# Altium schematic sheet 01.Izdelie.Units.SchDoc: Электронные модули и кабели
size 209 x 297 mm; Author: Мурашкин Д.В.; Address1: Address1; Address2: Address2; Address3: Address3; Address4: Address4; DocumentNumber: ИЗДЕЛИЕ-1-2 Э6; SheetNumber: 2; Scale: 1:1; Letter1Column: Э6
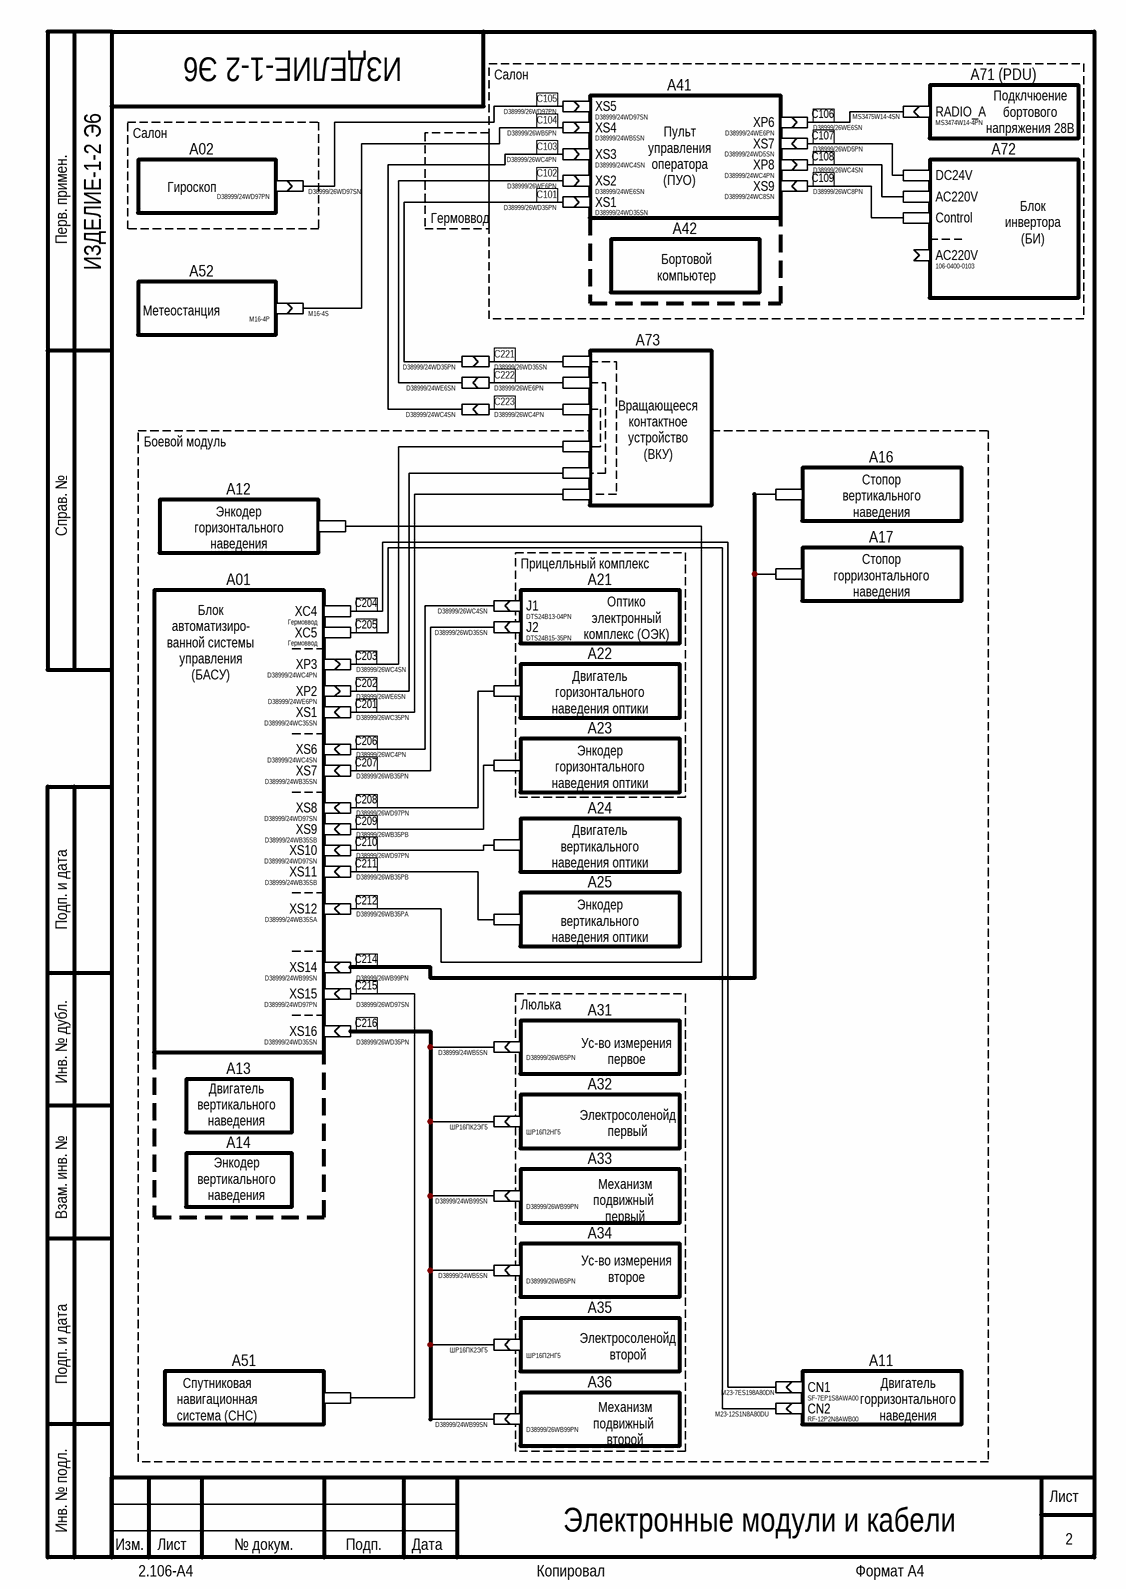
[diagram p0: 01.Izdelie.Units.SchDoc]

## Parts
(Parts that share a designator on the sheet are numbered #1, #2 ... from top to bottom, then left to right.)
A01.XP1  D38999/26WC35PN
A01.XP6  D38999/26WC4PN
A01.XP7  D38999/26WB35PN
A01.XP8  D38999/26WD97PN
A01.XP9  D38999/26WB35PB
A01.XP10  D38999/26WD97PN
A01.XP11  D38999/26WB35PB
A01.XP12  D38999/26WB35PA
A01.XP14  D38999/26WB99PN
A01.XP15  D38999/26WD97SN
A01.XP16  D38999/26WD35PN
A01.XS2  D38999/26WE6SN
A01.XS3  D38999/26WC4SN
A01.XS16.1  D38999/24WB5SN
A01.XS16.2  ШР16ПК2ЭГ5
A01.XS16.3  D38999/24WB99SN
A01.XS16.4  D38999/24WB5SN
A01.XS16.5  ШР16ПК2ЭГ5
A01.XS16.6  D38999/24WB99SN
A02.XP1  D38999/24WD97PN
A02.XS1  D38999/26WD97SN
A11.XS1  M23-7ES198A80DN  (no BOM)
A11.XS2  M23-12S1N8A80DU  (no BOM)
A12.XC1  Провод  (value not drawn)  (no BOM)
A16.XC1  Провод  (value not drawn)  (no BOM)
A17.XC1  Провод  (value not drawn)  (no BOM)
A21.XS1  D38999/26WC4SN
A21.XS2  D38999/26WD35SN
A22.XC1  Провод  (value not drawn)  (no BOM)
A23.XC1  Провод  (value not drawn)  (no BOM)
A24.XC1  Провод  (value not drawn)  (no BOM)
A25.XC1  Провод  (value not drawn)  (no BOM)
A31.XP1  D38999/26WB5PN
A32.XP1  ШР16П2НГ5  (no BOM)
A33.XP1  D38999/26WB99PN
A34.XP1  D38999/26WB5PN
A35.XP1  ШР16П2НГ5  (no BOM)
A36.XP1  D38999/26WB99PN
A41.XP1  D38999/26WD35PN
A41.XP2  D38999/26WE6PN
A41.XP3  D38999/26WC4PN
A41.XP4  D38999/26WB5PN
A41.XP5  D38999/26WD97PN
A41.XP7  D38999/26WD5PN
A41.XP9  D38999/26WC8PN
A41.XS6  D38999/26WE6SN
A41.XS8  D38999/26WC4SN
A51.XC1  (no value)  (no BOM)
A52.XP1  M16-4P  (no BOM)
A52.XS1  M16-4S  (no BOM)
A71.XS_RADIO_A  MS3475W14-4SN
A73.XC1  Провод  (value not drawn)  (no BOM)
A73.XC2  Провод  (value not drawn)  (no BOM)
A73.XC3  Провод  (value not drawn)  (no BOM)
A73.XC4  Провод  (value not drawn)  (no BOM)
A73.XC5  Провод  (value not drawn)  (no BOM)
A73.XC6  Провод  (value not drawn)  (no BOM)
A73.XP1  D38999/24WD35PN
A73.XP2  D38999/26WE6PN
A73.XP3  D38999/26WC4PN
A73.XS1  D38999/26WD35SN
A73.XS2  D38999/24WE6SN
A73.XS3  D38999/24WC4SN
AC220V#1  Провод  (value not drawn)  (no BOM)
AC220V#2  106-0400-0103
CN1  SF-7EP1S8AWA00  (no BOM)
CN2  RF-12P2N8AWB00  (no BOM)
Control  Провод  (value not drawn)  (no BOM)
DC24V  Провод  (value not drawn)  (no BOM)
J1  DTS24B13-04PN  (no BOM)
J2  DTS24B15-35PN  (no BOM)
RADIO_A  MS3474W14-4PN  (no BOM)
XC4  Гермоввод
XP2  D38999/24WE6PN
XP3  D38999/24WC4PN
XP6  D38999/24WE6PN
XP8  D38999/24WC4PN
XS1#1  D38999/24WD35SN
XS1#2  D38999/24WC35SN
XS2  D38999/24WE6SN
XS3  D38999/24WC4SN
XS4  D38999/24WB5SN
XS5  D38999/24WD97SN
XS6  D38999/24WC4SN
XS7#1  D38999/24WD5SN
XS7#2  D38999/24WB35SN
XS8  D38999/24WD97SN
XS9#1  D38999/24WC8SN
XS9#2  D38999/24WB35SB
XS10  D38999/24WD97SN
XS11  D38999/24WB35SB
XS12  D38999/24WB35SA
XS14  D38999/24WB99SN
XS15  D38999/24WD97PN
XS16  D38999/24WD35SN
XС5  Гермоввод

## Blocks framed on the sheet
A42: A41.XP1-A41.XP5 A41.XP7 A41.XP9 A41.XS6 A41.XS8 A71.XS_RADIO_A AC220V#1 Control DC24V XP6 XP8 XS7#1 XS9#1
A41: XS1#1 XS2-XS5
A71 (PDU): RADIO_A
A02: A02.XP1 A02.XS1
A72: AC220V#2
A21: J1 J2
A31: A31.XP1
A32: A32.XP1
A33: A33.XP1
A34: A34.XP1
A35: A35.XP1
A36: A36.XP1
A11: CN1 CN2

## Nets
С101: A41.XP1.0 A73.XP1.0
С102: A41.XP2.0 A73.XS2.0
С103: A41.XP3.0 A73.XS3.0
С104: A41.XP4.0 A52.XS1.0
С105: A02.XS1.0 A41.XP5.0
С106: A41.XS6.0 A71.XS_RADIO_A.0
С107: A41.XP7.0 DC24V.0
С108: A41.XS8.0 AC220V#1.0
С109: A41.XP9.0 Control.0
С201: A01.XP1.0 A73.XC6.0
С202: A01.XS2.0 A73.XC5.0
С203: A01.XS3.0 A73.XC4.0
С204: A11.XS1.0 XC4.1
С205: A11.XS2.0 XС5.1
С206: A01.XP6.0 A21.XS1.0
С207: A01.XP7.0 A21.XS2.0
С208: A01.XP8.0 A22.XC1.0
С209: A01.XP9.0 A23.XC1.0
С210: A01.XP10.0 A24.XC1.0
С211: A01.XP11.0 A25.XC1.0
С212: A01.XP12.0 A12.XC1.0
С214: A01.XP14.0 A16.XC1.0 A17.XC1.0
С215: A01.XP15.0 A51.XC1.0
С216: A01.XP16.0 A01.XS16.1.0 A01.XS16.2.0 A01.XS16.3.0 A01.XS16.4.0 A01.XS16.5.0 A01.XS16.6.0
С221: A73.XC1.0 A73.XS1.0
С222: A73.XC2.0 A73.XP2.0
С223: A73.XC3.0 A73.XP3.0

Not connected (* = marked no-connect by the designer): A02.XP1 0; A31.XP1 0; A32.XP1 0; A33.XP1 0; A34.XP1 0; A35.XP1 0; A36.XP1 0; A51.XC1 1; A52.XP1 0; AC220V#2 0; CN1 0; CN2 0; J1 0; J2 0; RADIO_A 0; XC4 0; XP2 0; XP3 0; XP6 0; XP8 0; XS1#1 0; XS1#2 0; XS2 0; XS3 0; XS4 0; XS5 0; XS6 0; XS7#1 0; XS7#2 0; XS8 0; XS9#1 0; XS9#2 0; XS10 0; XS11 0; XS12 0; XS14 0; XS15 0; XS16 0; XС5 0

## Notes on the sheet
- Салон
- (near A02.XP1) Гироскоп
- Пульт управления оператора (ПУО)
- Подклчюение бортового напряжения 28В
- Гермоввод
- Блок инвертора (БИ)
- Метеостанция
- A52
- Бортовой компьютер
- A73
- Боевой модуль
- Вращающееся контактное устройство (ВКУ)
- A16
- A12
- (near A16.XC1) Стопор вертикального наведения
- (near A12.XC1) Энкодер горизонтального наведения
- A01
- Прицелльный комплекс
- (near A17.XC1) Стопор горризонтального наведения
- A17
- Оптико электронный комплекс (ОЭК)
- A22
- Блок автоматизиро- ванной системы управления (БАСУ)
- (near A22.XC1) Двигатель горизонтального наведения оптики
- A23
- (near A23.XC1) Энкодер горизонтального наведения оптики
- (near A24.XC1) Двигатель вертикального наведения оптики
- A24
- A25
- (near A25.XC1) Энкодер вертикального наведения оптики
- Люлька
- Ус-во измерения первое
- Двигатель вертикального наведения
- A13
- Электросоленойд первый
- Энкодер вертикального наведения
- A14
- Механизм подвижный
  первый
- Ус-во измерения второе
- A51
- Электросоленойд второй
- (near A51.XC1) Спутниковая навигационная система (СНС)
- Механизм подвижный
  второй
- Двигатель горризонтального наведения
- Перв. примен.
- Справ. №
- Подп. и дата
- Инв. № дубл.
- Взам. инв. №
- Инв. № подл.
- Изм.
- Лист
- № докум.
- Подп.
- Дата
- 2.106-A4
- Копировал
- Формат А4

## Library data of the parts
A01.XP1 A01.XP6-A01.XP12 A01.XP14-A01.XP16 A02.XP1 A31.XP1 A32.XP1 A33.XP1 A34.XP1 A35.XP1 A36.XP1 A41.XP1-A41.XP5 A41.XP7 A41.XP9 A52.XP1 A73.XP1-A73.XP3 J1 J2 RADIO_A XP2 XP3 XP6 XP8 = Connector cable plug: Operating temperature: -°C +°C; Dimension: .0mm x .0mm; Height: .0mm
  A01.XP1: Part name: D38999/26WC35PN; Mounting type: Surface mount
  A01.XP6 A41.XP3 A73.XP3: Part name: D38999/26WC4PN; Mounting type: Surface mount
  A01.XP7: Part name: D38999/26WB35PN; Mounting type: Surface mount
  A01.XP8 A01.XP10 A41.XP5: Part name: D38999/26WD97PN; Mounting type: Surface mount
  A01.XP9 A01.XP11: Part name: D38999/26WB35PB; Mounting type: Surface mount
  A01.XP12: Part name: D38999/26WB35PA; Mounting type: Surface mount
  A01.XP14 A33.XP1 A36.XP1: Part name: D38999/26WB99PN; Mounting type: Surface mount
  A01.XP15: Part name: D38999/26WD97SN; Mounting type: Surface mount
  A01.XP16 A41.XP1: Part name: D38999/26WD35PN; Mounting type: Surface mount
  A02.XP1: Part name: D38999/24WD97PN; Mounting type: Surface mount
  A31.XP1 A34.XP1 A41.XP4: Part name: D38999/26WB5PN; Mounting type: Surface mount
  A32.XP1 A35.XP1: Part name: ШР16П2НГ5; Mounting type: Surface mount
  A41.XP2 A73.XP2: Part name: D38999/26WE6PN; Mounting type: Surface mount
  A41.XP7: Part name: D38999/26WD5PN; Mounting type: Surface mount
  A41.XP9: Part name: D38999/26WC8PN; Mounting type: Surface mount
  A52.XP1: Part name: M16-4P; Mounting type: Surface mount
  A73.XP1: Part name: D38999/24WD35PN; Mounting type: Surface mount
  J1: Part name: DTS24B13-04PN; Mounting type: Surface mount
  J2: Part name: DTS24B15-35PN; Mounting type: Surface mount
  RADIO_A: Part name: MS3474W14-4PN; Mounting type: Panel
  XP2 XP6: Part name: D38999/24WE6PN; Mounting type: Surface mount
  XP3 XP8: Part name: D38999/24WC4PN; Mounting type: Surface mount
A01.XS2 A01.XS3 A01.XS16.1-A01.XS16.6 A02.XS1 A21.XS1 A21.XS2 A41.XS6 A41.XS8 A52.XS1 A71.XS_RADIO_A A73.XS1-A73.XS3 XS1#1 XS1#2 XS2-XS6 XS7#1 XS7#2 XS8 XS9#1 XS9#2 XS10-XS12 XS14-XS16 = Connector cable socket: Operating temperature: -°C +°C; Dimension: .0mm x .0mm; Height: .0mm
  A01.XS2 A41.XS6: Part name: D38999/26WE6SN; Mounting type: Surface mount
  A01.XS3 A21.XS1 A41.XS8: Part name: D38999/26WC4SN; Mounting type: Surface mount
  A01.XS16.1 A01.XS16.4 XS4: Part name: D38999/24WB5SN; Mounting type: Surface mount
  A01.XS16.2 A01.XS16.5: Part name: ШР16ПК2ЭГ5; Mounting type: Surface mount
  A01.XS16.3 A01.XS16.6 XS14: Part name: D38999/24WB99SN; Mounting type: Surface mount
  A02.XS1: Part name: D38999/26WD97SN; Mounting type: Surface mount
  A21.XS2 A73.XS1: Part name: D38999/26WD35SN; Mounting type: Surface mount
  A52.XS1: Part name: M16-4S; Mounting type: Surface mount
  A71.XS_RADIO_A: Part name: MS3475W14-4SN; Mounting type: Cable
  A73.XS2 XS2: Part name: D38999/24WE6SN; Mounting type: Surface mount
  A73.XS3 XS3 XS6: Part name: D38999/24WC4SN; Mounting type: Surface mount
  XS1#1 XS16: Part name: D38999/24WD35SN; Mounting type: Surface mount
  XS1#2: Part name: D38999/24WC35SN; Mounting type: Surface mount
  XS5 XS8 XS10: Part name: D38999/24WD97SN; Mounting type: Surface mount
  XS7#1: Part name: D38999/24WD5SN; Mounting type: Surface mount
  XS7#2: Part name: D38999/24WB35SN; Mounting type: Surface mount
  XS9#1: Part name: D38999/24WC8SN; Mounting type: Surface mount
  XS9#2 XS11: Part name: D38999/24WB35SB; Mounting type: Surface mount
  XS12: Part name: D38999/24WB35SA; Mounting type: Surface mount
  XS15: Part name: D38999/24WD97PN; Mounting type: Surface mount
A11.XS1 A11.XS2 = Connector cable socket: Manufacturer: Phoenix Contact; Operating temperature: -°C +°C; Mounting type: Cable mount; Dimension: .0mm x .0mm; Height: .0mm
  A11.XS1: Part name: M23-7ES198A80DN
  A11.XS2: Part name: M23-12S1N8A80DU
A12.XC1 A16.XC1 A17.XC1 A22.XC1 A23.XC1 A24.XC1 A25.XC1 A51.XC1 A73.XC1-A73.XC6 AC220V#1 Control DC24V XC4 XС5 = Connector cable coupling: Operating temperature: -°C +°C; Mounting type: Surface mount; Dimension: .0mm x .0mm; Height: .0mm
AC220V#2 = Connector cable socket: Socet 220V 2Р+РЕ 1x16А; Manufacturer: LEZARD; Part name: 106-0400-0103; Operating temperature: -°C +°C; Mounting type: Wall mount; Dimension: .0mm x .0mm; Height: .0mm
CN1 CN2 = Connector cable plug: Manufacturer: Phoenix Contact; Operating temperature: -°C +°C; Mounting type: Panel mount; Dimension: .0mm x .0mm; Height: .0mm
  CN1: Part name: SF-7EP1S8AWA00
  CN2: Part name: RF-12P2N8AWB00